# Altium schematic sheet STPMotorControl3_1.SchDoc
size A4; SheetNumber: 4; SheetTotal: 8
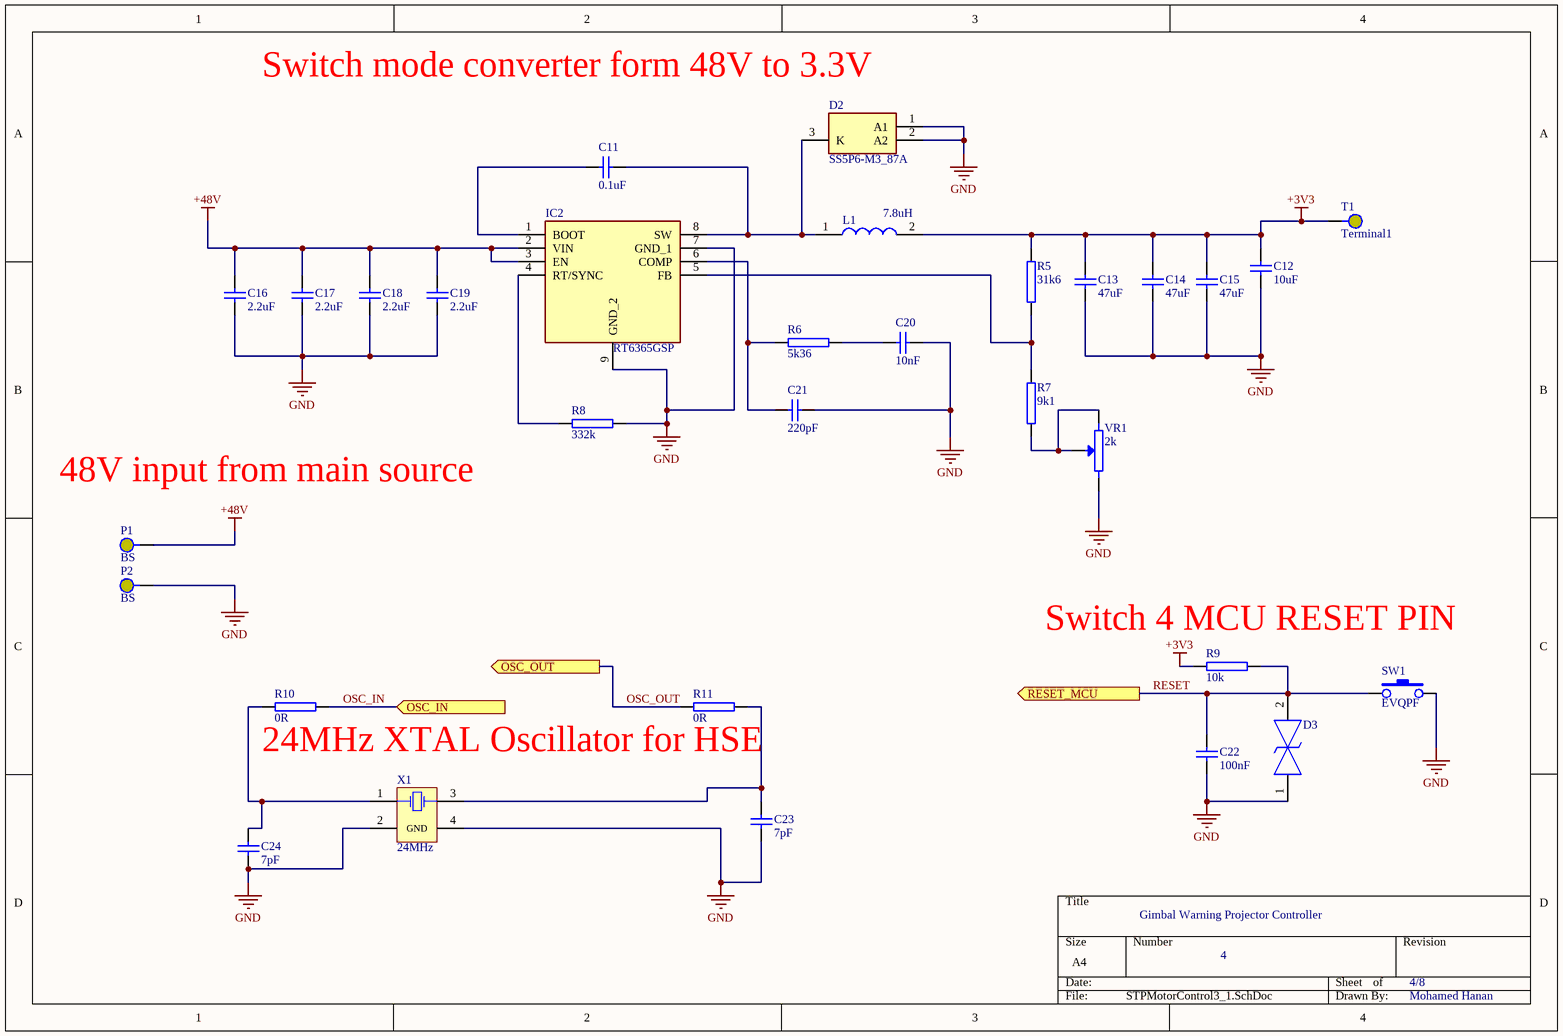
[diagram p0: STPMotorControl3_1.SchDoc]

## Parts
C11  0.1uF  [CAP_1206]
C12  10uF  [CAP_1206]
C13  47uF  [CAP_1206]
C14  47uF  [CAP_1206]
C15  47uF  [CAP_1206]
C16  2.2uF  [CAP_0805]
C17  2.2uF  [CAP_0805]
C18  2.2uF  [CAP_0805]
C19  2.2uF  [CAP_0805]
C20  10nF  [CAP_0805]
C21  220pF  [CAP_1206]
C22  100nF  [CAP_0805]
C23  7pF  [CAP_0805]
C24  7pF  [CAP_0805]
D2  SS5P6-M3_87A  [SS5P6M387A]
D3  TSD05CDYFR  [SOD2613X100N]  (value not drawn)
IC2  RT6365GSP  [SOIC127P600X175-9N]
L1  7.8uH  [WE-HCI_103023]
P1  BS  [Banana_AUT]
P2  BS  [Banana_AUT]
R5  31k6  [RES_0805]
R6  5k36  [RES_0805]
R7  9k1  [RES_0805]
R8  332k  [RES_0805]
R9  10k  [RES_0805]
R10  0R  [RES_0805]
R11  0R  [RES_0805]
SW1  EVQPF  [EVQPF203M]
T1  Terminal1  [PAD1_AUT]
VR1  2k  [3362S]
X1  24MHz  [CX2520SB]

## Ports
OSC_IN (in, see STPMotorConnections[3B], STPMotorControl_1[1B]), OSC_OUT (out, see STPMotorConnections[3B], STPMotorControl_1[1B]), RESET_MCU (out, see STPMotorConnections[3B], STPMotorControl_1[1B])

## Nets
+3V3: C12.2 C13.2 C14.2 C15.2 L1.2 R5.2 R9.2 T1.1
+48V: C16.2 C17.2 C18.2 C19.2 IC2.2(VIN) IC2.3(EN) P1.1
GND: C12.1 C13.1 C14.1 C15.1 C16.1 C17.1 C18.1 C19.1 C20.2 C21.2 C22.1 C23.2 C24.2 D2.1(A1) D2.2(A2) D3.1 IC2.7(GND_1) IC2.9(GND_2) P2.1 R8.2 SW1.2 VR1.2(BOT) X1.2(GND) X1.4(GND)
OSC_IN: R10.2 ; port OSC_IN
OSC_OUT: R11.1 ; port OSC_OUT
RESET: C22.2 D3.2 R9.1 SW1.1 ; port RESET_MCU
NetC11_1: C11.1 IC2.1(BOOT)
NetC11_2: C11.2 D2.3(K) IC2.8(SW) L1.1
NetC20_1: C20.1 R6.2
NetC21_1: C21.1 IC2.6(COMP) R6.1
NetC23_1: C23.1 R11.2 X1.3(OSC2)
NetC24_1: C24.1 R10.1 X1.1(OSC1)
NetIC2_4: IC2.4(RT/SYNC) R8.1
NetIC2_5: IC2.5(FB) R5.1 R7.2
NetR7_1: R7.1 VR1.1(TOP) VR1.W(TAP)

## Notes on the sheet
- (near D2) Switch mode converter form 48V to 3.3V
- 48V input from main source
- (near R9) Switch 4 MCU RESET PIN
- 24MHz XTAL Oscillator for HSE
- Gimbal Warning Projector Controller
- 4
- 4/8
- Mohamed Hanan

## Library data of the parts
C11-C15 C21 = CAPN 1206: Non Polarized Capacitor, SMD, 1206
C16-C20 C22-C24 = CAPN 0805: Non Polarized Capacitor, SMD, 0805
D2 = SS5P6-M3_87A: Schottky Diode; Manufacturer_Name: Vishay; Manufacturer_Part_Number: SS5P6-M3/87A; Datasheet Link: https://www.vishay.com/docs/88988/ss5p6.pdf; Height: 1.2mm; Mouser Part Number: 625-SS5P6-M3/87A; Mouser Price/Stock: https://www.mouser.co.uk/ProductDetail/Vishay-General-Semiconductor/SS5P6-M3-87A?qs=XGzIaZb%2FFYLx0h%2FWoI%2FVUQ%3D%3D; Arrow Part Number: SS5P6-M3/87A; Arrow Price/Stock: https://www.arrow.com/en/products/ss5p6-m387a/vishay?utm_currency=USD&region=nac
D3 = TSD05CDYFR: TVS Diode (Bi-directional); Manufacturer_Name: Texas Instruments; Datasheet Link: https://www.ti.com/lit/ds/symlink/tsd05c.pdf?ts=1691730725852&ref_url=https%253A%252F%252Fwww.ti.com%252Fproduct%252FTSD05C%253FkeyMatch%253DTSD05CDYFR%2526tisearch%253Dsearch-everything%2526usecase%253DOPN; Height: 1mm; Manufacturer_Part_Number: TSD05CDYFR; Mouser Part Number: 595-TSD05CDYFR; Mouser Price/Stock: https://www.mouser.co.uk/ProductDetail/Texas-Instruments/TSD05CDYFR?qs=Imq1NPwxi74wAiGFX0POZQ%3D%3D; Arrow Part Number: TSD05CDYFR; Arrow Price/Stock: https://www.arrow.com/en/products/tsd05cdyfr/texas-instruments.html?utm_currency=USD&region=nac
IC2 = RT6365GSP: Integrated Circuit; Manufacturer_Name: RICHTEK; Datasheet Link: https://www.richtek.com/assets/product_file/RT6365/DS6365-02.pdf; Height: 1.753mm; Manufacturer_Part_Number: RT6365GSP; Mouser Part Number: 835-RT6365GSP; Mouser Price/Stock: https://www.mouser.co.uk/ProductDetail/Richtek/RT6365GSP?qs=amGC7iS6iy%252BGHkAL3RFUug%3D%3D
L1 = 744325780: Inductor; Manufacturer_Name: Wurth Elektronik; Datasheet Link: https://www.we-online.com/catalog/datasheet/744325780.pdf; Height: 4.7mm; Manufacturer_Part_Number: 744325780; Mouser Part Number: 710-744325780; Mouser Price/Stock: https://www.mouser.co.uk/ProductDetail/Wurth-Elektronik/744325780?qs=VxkwJfKV0FQ2%2FeCS8beGcw%3D%3D
P1 P2 = Banana Socket: Banana Socket, 4mm, Panel, Black, 10A; Supplier 1: Farnell; Supplier Part Number 1: 1101113
R5-R11 = Resistor 0805: Resistor, SMD, 0805
SW1 = EVQPF: PANASONIC  EVQPF203M  SWITCH, TACTILE, SPST-NO, 20mA, 15VDC; Supplier 1: Farnell; Supplier Part Number 1: 2079505
T1 = Terminal1: Terminal, Pad 70x70mil, Hole 32 mil
VR1 = 3362S-1-202LF: 3362S Series, 1/4 ” Square  Potentiometer, 2k, 10%, 0.5 Watts, 1Turn; Supplier 1: Farnell; Supplier Part Number 1: 2321842
X1 = CX2520SB24000D0FLJZZ: Crystals, 24MHz; Supplier 1: Farnell; Supplier Part Number 1: 1657889